# Altium schematic sheet 06_RISK_ALERT.SchDoc
size A4; SheetNumber: 6; SheetTotal: 6
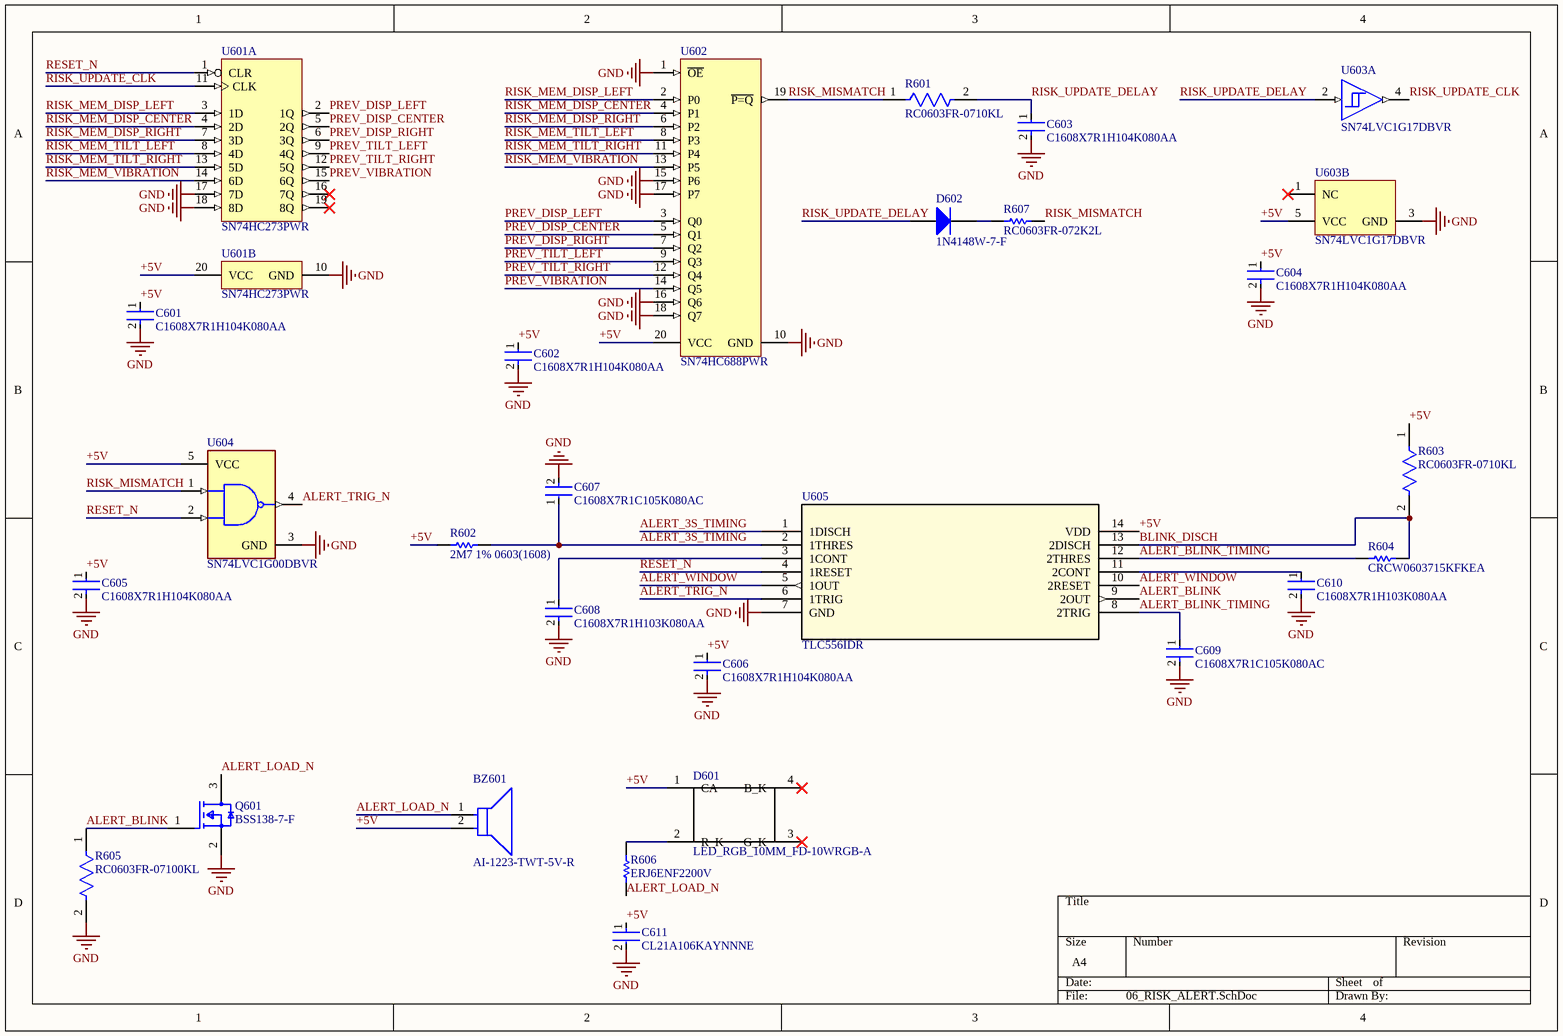
[diagram p0: 06_RISK_ALERT.SchDoc]

## Parts
BZ601  AI-1223-TWT-5V-R  [FP-AI-1223-TWT-5V-R-MFG]
C601  C1608X7R1H104K080AA  [FP-C1608-080-0_1-IPC_B]
C602  C1608X7R1H104K080AA  [FP-C1608-080-0_1-IPC_B]
C603  C1608X7R1H104K080AA  [FP-C1608-080-0_1-IPC_B]
C604  C1608X7R1H104K080AA  [FP-C1608-080-0_1-IPC_B]
C605  C1608X7R1H104K080AA  [FP-C1608-080-0_1-IPC_B]
C606  C1608X7R1H104K080AA  [FP-C1608-080-0_1-IPC_B]
C607  C1608X7R1C105K080AC  [FP-C1608-080-0_1-IPC_B]
C608  C1608X7R1H103K080AA  [FP-C1608-080-0_1-MFG]
C609  C1608X7R1C105K080AC  [FP-C1608-080-0_1-IPC_B]
C610  C1608X7R1H103K080AA  [FP-C1608-080-0_1-MFG]
C611  CL21A106KAYNNNE  [FP-CL21-IPC_A]
D601  LED_RGB_10MM_FD-10WRGB-A  [LED_THT_RGB_10MM_FD10WRGBA]
D602  1N4148W-7-F  [DIOD-SOD123-2_V]
Q601  BSS138-7-F  [FP-SOT23_Standard-MFG]
R601  RC0603FR-0710KL  [FP-RC0603-0_55-IPC_C]
R602  2M7 1% 0603(1608)  [RESC0603(1608)_L]
R603  RC0603FR-0710KL  [FP-RC0603-0_55-IPC_C]
R604  CRCW0603715KFKEA  [RESC1609X50X30NL10T20]
R605  RC0603FR-07100KL  [FP-RC0603-0_55-MFG]
R606  ERJ6ENF2200V  [RESC2013X70X40NL20T20]
R607  RC0603FR-072K2L  [RESC1608X55X25LL10T15]
U601  SN74HC273PWR  [PW0020A_N]  (parts A,B of 2)
U602  SN74HC688PWR  [PW0020A_M]
U603  SN74LVC1G17DBVR  [DBV0005A_L]  (parts A,B of 2)
U604  SN74LVC1G00DBVR  [FP-DBV0005A-MFG]
U605  TLC556IDR  [D14]

## Nets
GND: C601.2 C602.2 C603.2 C604.2 C605.2 C606.2 C607.2 C608.2 C609.2 C610.2 C611.2 Q601.2(S) R605.2 U601.10(GND) U601.17(7D) U601.18(8D) U602.1(~{OE}) U602.10(GND) U602.15(P6) U602.16(Q6) U602.17(P7) U602.18(Q7) U603.3(GND) U604.3(GND) U605.7(GND)
+5V: BZ601.2(A) C601.1 C602.1 C604.1 C605.1 C606.1 C611.1 D601.1(CA) R602.1 R603.1 U601.20(VCC) U602.20(VCC) U603.5(VCC) U604.5(VCC) U605.14(VDD)
ALERT_3S_TIMING: C607.1 R602.2 U605.1(1DISCH) U605.2(1THRES)
ALERT_BLINK: Q601.1(G) R605.1 U605.9(2OUT)
ALERT_BLINK_TIMING: C609.1 R604.1 U605.8(2TRIG) U605.12(2THRES)
ALERT_LOAD_N: BZ601.1(C) Q601.3(D) R606.2
ALERT_TRIG_N: U604.4(Y) U605.6(1TRIG)
ALERT_WINDOW: U605.5(1OUT) U605.10(2RESET)
BLINK_DISCH: R603.2 R604.2 U605.13(2DISCH)
PREV_DISP_CENTER: U601.5(2Q) U602.5(Q1)
PREV_DISP_LEFT: U601.2(1Q) U602.3(Q0)
PREV_DISP_RIGHT: U601.6(3Q) U602.7(Q2)
PREV_TILT_LEFT: U601.9(4Q) U602.9(Q3)
PREV_TILT_RIGHT: U601.12(5Q) U602.12(Q4)
PREV_VIBRATION: U601.15(6Q) U602.14(Q5)
RESET_N: U601.1(CLR) U604.2(B) U605.4(1RESET)
RISK_MEM_DISP_CENTER: U601.4(2D) U602.4(P1)
RISK_MEM_DISP_LEFT: U601.3(1D) U602.2(P0)
RISK_MEM_DISP_RIGHT: U601.7(3D) U602.6(P2)
RISK_MEM_TILT_LEFT: U601.8(4D) U602.8(P3)
RISK_MEM_TILT_RIGHT: U601.13(5D) U602.11(P4)
RISK_MEM_VIBRATION: U601.14(6D) U602.13(P5)
RISK_MISMATCH: R601.1 R607.2 U602.19(~{P=Q}) U604.1(A)
RISK_UPDATE_CLK: U601.11(CLK) U603.4(Y)
RISK_UPDATE_DELAY: C603.1 D602.1(A) R601.2 U603.2(A)
NetC608_1: C608.1 U605.3(1CONT)
NetC610_1: C610.1 U605.11(2CONT)
NetD601_2: D601.2(R_K) R606.1
NetD602_2: D602.2(K) R607.1

Not connected (* = marked no-connect by the designer): D601 3(G_K)* 4(B_K)*; U601 16(7Q)* 19(8Q)*; U603 1(NC)*

## Library data of the parts
BZ601 = CMP-231724-000001-1: AUDIO MAGNETIC INDICATOR 3-7V TH; Input Type: DC; Bandwidth: 2.3kHz; Nominal Supply Voltage (DC): 5V; Max Supply Current: 30mA; Washable: Yes; Max Supply Voltage (DC): 7V; Min Supply Voltage: 3V; Series: AI; Width: 12mm; REACH SVHC: No SVHC; Contact Plating: Tin; Frequency: 2.3kHz; Operating Supply Current: 30mA; Weight: 0.01lb; Current Rating: 30mA; Mount: Through Hole; Packaging: Tray; Length: 12mm; Lead Free: Lead Free; Color: Black; Input Current: 30mA; Min Operating Temperature: -40°C; Self Resonant Frequency: 2.3kHz; Sensing Method: Magnetic; Voltage Rating (DC): 5V; Height: 9.5mm; Termination: PC Pins; Min Supply Voltage (DC): 3V; Package Quantity: 100; Max Supply Voltage: 7V; Diameter: 12mm; Max Operating Temperature: 85°C
C601-C606 = CMP-2000-04982-2: Multilayer Ceramic Capacitors 100nF ±10% 50V X7R SMD 0603; REACH SVHC: No SVHC; Voltage: 50V; Min Operating Temperature: -55°C; Package Quantity: 1; Case Code (Metric): 1608; Series: C; Termination: SMD/SMT; Length: 1.6mm; Voltage Rating: 50V; Case Code (Imperial): 0603; Number of Pins: 2; RoHS Compliant: Yes; Thickness: 0.037inch; Resistor Type: Ceramic; Radiation Hardening: No; Weight: 7.1E-05oz; Mount: Surface Mount; Capacitance: 100nF; Voltage Rating (DC): 50V; Construction: Flat; Tolerance: 10%; Lead Free: Lead Free; Case/Package: 0603; Max Operating Temperature: 125°C; Height: 0.8mm; Depth: 0.8mm; Packaging: Tape and Reel; Width: 0.031inch; Dielectric Material: Ceramic; Dielectric: X7R
C607 C609 = CMP-08246-002727-1: Multilayer Ceramic Capacitors 1μF ±10% 16V X7R SMD 0603; Capacitance: 1uF; Mount: Surface Mount; Width: 0.031inch; Radiation Hardening: No; Dielectric Material: Ceramic; Packaging: Tape and Reel; Voltage Rating: 16V; Weight: 7.1E-05oz; Termination: SMD/SMT; Package Quantity: 1; Voltage Rating (DC): 16V; REACH SVHC: No SVHC; Voltage: 16V; Min Operating Temperature: -55°C; Depth: 0.8mm; Height: 0.8mm; Length: 1.6mm; Case Code (Metric): 1608; Thickness: 0.037inch; Lead Free: Lead Free; Resistor Type: Ceramic; RoHS Compliant: Yes; Series: C; Construction: Flat; Max Operating Temperature: 125°C; Tolerance: 10%; Case/Package: 0603; Dielectric: X7R; Case Code (Imperial): 0603
C608 C610 = CMP-2000-06026-2: Multilayer Ceramic Capacitors 10nF ±10% 50V X7R SMD 0603; Voltage: 50V; Depth: 0.8mm; REACH SVHC: No SVHC; Packaging: Tape and Reel; Dielectric Material: Ceramic; Dielectric: X7R; Min Operating Temperature: -55°C; Package Quantity: 1; Width: 0.031inch; Case Code (Imperial): 0603; Radiation Hardening: No; Length: 1.6mm; RoHS Compliant: Yes; Tolerance: 10%; Termination: SMD/SMT; Mount: Surface Mount; Construction: Flat; Resistor Type: Ceramic; Max Operating Temperature: 125°C; Series: C; Lead Free: Lead Free; Capacitance: 10nF; Voltage Rating (DC): 50V; Thickness: 0.037inch; Voltage Rating: 50V; Height: 0.8mm; Weight: 7.1E-05oz; Case/Package: 0603; Case Code (Metric): 1608
C611 = CMP-13271-002975-1: CL21 Series 0805 10uF 25V ±10% Tolerance X5R Multilayer Ceramic Chip Capacitor; Case Code (Imperial): 0805; Length: 2mm; Case/Package: 0805; Packaging: Tape and Reel; Width: 0.049inch; Tolerance: 10%; Mount: Surface Mount; Min Operating Temperature: -55°C; Thickness: 0.057inch; Height: 1.25mm; Dielectric: X5R; Package Quantity: 1; Depth: 1.25mm; Capacitance: 10uF; Voltage Rating: 25V; Case Code (Metric): 2012; Max Operating Temperature: 85°C; Radiation Hardening: No
D602 = CMP-2000-04932-2: Fast Switching Diode, 100 V, 0.15 A, -65 to 150 degC, 2-Pin?SOD123, RoHS, Tape and Reel; Recovery Time: 4ns; Brand: DiodesIncorporated; Unit Weight: 0.000353oz; Max Surge Current: 2A; Peak Reverse Voltage: 100V; Ir - Reverse Current: 1uA; Vf - Forward Voltage: 1.25V; Configuration: Single; If - Forward Current: 0.15A; Product Category: Diodes-GeneralPurpose,Power,Switching; Operating Temperature Range: -65Cto+150C; Packaging: Reel; Manufacturer URL: http://www.diodes.com/; Maximum Operating Temperature: +150C; Height: 1.25mm; Minimum Operating Temperature: -65C; Product: SwitchingDiodes; Package URL: http://www.diodes.com/datasheets/ds18004.pdf; Type: SwitchingDiode; Package Reference: SOD123-2; Width: 1.7mm; Datasheet URL: http://www.farnell.com/datasheets/1915529.pdf; Datasheet Version: Rev. 24-2, 10/2013; Series: 1N4148; Factory Pack Quantity: 3000; Length: 2.85mm; RoHS: True; Manufacturer: DiodesIncorporated; Mounting Style: SMD/SMT; Package / Case: SOD-123
Q601 = CMP-2000-04930-2: NexarPartId: 335900; Voltage: 50V; Fall Time: 25ns; Number of Elements: 1; Turn-On Delay Time: 20ns; Drain to Source Resistance: 1.4Ω; Element Configuration: Single; Max Power Dissipation: 300mW; Current Rating: 200mA; Max Junction Temperature (Tj): 150°C; Input Capacitance: 50pF; Threshold Voltage: 1.2V; Current: 2A; Rds On Max: 3.5Ω; Rise Time: 10ns; Gate to Source Voltage (Vgs): 20V; Number of Pins: 3; Width: 1.3mm; Case/Package: SOT-23; Lead Free: Lead Free; Height: 1.15mm; Packaging: Cut Tape; Length: 2.9mm; REACH SVHC: No SVHC; Weight: 7.994566mg; Voltage Rating (DC): 50V; Contact Plating: Tin; Power Dissipation: 300mW; Mount: Surface Mount; Min Operating Temperature: -55°C; RoHS: Compliant; Max Operating Temperature: 150°C; Schedule B: 8541210080, 8541210080; Drain to Source Breakdown Voltage: 50V; Continuous Drain Current (ID): 200mA; Resistance: 3.5Ω; Number of Channels: 1; Drain to Source Voltage (Vdss): 50V; Turn-Off Delay Time: 20ns; Nominal Vgs: 1.2V
R601 R603 = CMP-2100-03664-2: RES 10K OHM 1% 1/10W 0603; Voltage Rating: 75V; Voltage Rating (DC): 50V; Resistance: 10kR; Power Rating: 100mW; Temperature Coefficient: 100ppm/°C; Depth: 0.8mm; Termination: SMD/SMT; Resistor Type: Thick Film; Series: RC; Construction: Rectangular; Features: Moisture Resistant; Packaging: Tape and Reel; Min Operating Temperature: -55°C; Number of Terminations: 2; Lead Pitch: 0.3mm; RoHS Compliant: Yes; Case/Package: 0603; Resistance Tolerance: 1%; Military Standard: Not; Weight: 7.1E-05oz; Number of Pins: 2; Tolerance: 1%; Length: 1.6mm; Case Code (Imperial): 0603; Lead Free: Lead Free; Width: 0.8mm; Max Power Dissipation: 100mW; Height: 0.45mm; Max Operating Temperature: 155°C; Case Code (Metric): 1608; Size Code: 0603
R602 = CMP-1012-00896-1: 2M7 0.1W 1% 0603 (1608 Metric)  SMD; Case-Metric: 1608; Value: 2700000.00 Ohm; Case-EIA: 0603; Power: 0.1 W; Technology: SMT; Tolerance: 1 %
R604 = CMP-2000-03560-1: Manufacturer: Vishay Dale; Part Number: CRCW0603715KFKEA
R605 = CMP-2100-03662-2: RES SMD 100K OHM 1% 1/10W 0603; Voltage Rating (DC): 50V; Resistance: 100kR; Max Power Dissipation: 100mW; Temperature Coefficient: 100ppm/°C; Working Voltage: 75V; Length: 1.6mm; Lead Free: Lead Free; Number of Terminations: 2; Packaging: Tape and Reel; Voltage Rating: 50V; Termination: SMD/SMT; Width: 0.8mm; Resistor Type: Thick Film; Resistance Tolerance: 1%; Features: Moisture Resistant; Height: 0.45mm; Construction: Rectangular; Case/Package: 0603; Military Standard: Not; Case Code (Imperial): 0603; Series: RC; Technology: THICK FILM; Depth: 0.8mm; RoHS Compliant: Yes; REACH SVHC: No SVHC; Min Operating Temperature: -55°C; Case Code (Metric): 1608; Max Operating Temperature: 155°C; Power Rating: 100mW; Number of Pins: 2; Tolerance: 1%
R606 = CMP-2001-00044-1: Manufacturer: Panasonic; Part Number: ERJ6ENF2200V
R607 = CMP-2000-06934-1: Thick Film Resistor, 2.2 KOhm, 100 mW, 50 V, +/- 1%, -55 to 155 degC, 2-Pin SMD (0603), RoHS, Tape and Reel; Manufacturer: Yageo; Resistance: 2.2kOhms; Temperature Coefficient: 100PPM/C; Voltage Rating: 50V; Power Rating: 100mW; Tolerance: 1%; Datasheet Version: Rev. 7, 05/2017; Case Code - mm: 1608; Series: RC; Mounting Technology: SurfaceMount; Package Description: 2-Pin Surface Mount Device, Body 1.6 x 0.8 mm; Case Code - in: 0603; Package Reference: 0603; Product: ThickFilmResistorsGeneralPurpose; Manufacturer URL: http://www.yageo.com/; Termination Style: SMD/SMT; Operating Temperature Range: -55Cto+155C; Datasheet URL: http://www.yageo.com/documents/recent/PYu-RC_Group_51_RoHS_L_7.pdf; Packaging: Reel
U601 = CMP-1619-00964-2: Octal D-Type Flip-Flops With Clear, PW0020A, LARGE T&R; Manufacturer: Texas Instruments; VCC(Min)(V): 2; VCC(Max)(V): 6; Schmitt Trigger: No; Rating: Catalog; Output Drive (IOL/IOH)(Max)(mA): 5.2/-5.2; Output Type: CMOS; Bits(#): 8; tpd @ Nom Voltage(Max)(ns): 34; F @ Nom Voltage(Max)(Mhz): 28; Output: 2S; ICC @ Nom Voltage(Max)(mA): 0.08; Technology Family: HC; Voltage(Nom)(V): 3.3,5; Output Logic: Non-inverted; Code_JEDEC: MO-153; PackageReference: PW0020A; DatasheetVersion: SCLS136D; 3-State Output: No; Operating Temperature Range(C): -40 to 85; Generic Part Number: SN74HC273; Input Type: CMOS
U602 = CMP-1581-00122-3: 8-Bit Identity/Magnitude Comparators (P=Q) with Enable, PW0020A, LARGE T&R; Manufacturer: Texas Instruments; ICC @ Nom Voltage(Max)(mA): 0.08; F @ Nom Voltage(Max)(Mhz): 70; Bits(#): 8; tpd @ Nom Voltage(Max)(ns): 45; VCC(Max)(V): 6; Output Type: CMOS; VCC(Min)(V): 2; Technology Family: HC; Rating: Catalog; Schmitt Trigger: No; Output Drive (IOL/IOH)(Max)(mA): 5.2/-5.2; DatasheetVersion: SCLS010D; Operating Temperature Range(C): -40 to 85; Generic Part Number: SN74HC688; Voltage(Nom)(V): 6; Input Type: CMOS; PackageReference: PW0020A
U603 = CMP-0859-00033-4: Single Schmitt-Trigger Buffer, DBV0005A, LARGE T&R; Manufacturer: Texas Instruments; Output Drive (IOL/IOH)(Max)(mA): 32/-32; Technology Family: LVC; ICC @ Nom Voltage(Max)(mA): 0.01; VCC(Min)(V): 1.65; F @ Nom Voltage(Max)(Mhz): 150; Schmitt Trigger: Yes; Voltage(Nom)(V): 1.8,2.5,3.3,5; 3-State Output: No; Bits(#): 1; VCC(Max)(V): 5.5; Input Type: CMOS/TTL; Logic: True; tpd @ Nom Voltage(Max)(ns): 11,6.5,5.5,5; Output Type: CMOS; Rating: Catalog; Sub-Family: Non-Inverting Buffer/Driver; PackageReference: DBV0005A; DatasheetVersion: SCES351V; Generic Part Number: SN74LVC1G17; Operating Temperature Range(C): -40 to 125,-40 to 85
U604 = CMP-0859-00113-4: IC GATE NAND 1CH 2-INP SOT23-5; Manufacturer: Texas Instruments; Logic Function Desc: Inverting; Number Of Circuits: 1; Nominal Supply Current: 10uA; Max Supply Voltage: 5.5V; Standoff Height: 0mm; Frequency: 100MHz; Propagation Delay: 4.3ns; Min Supply Voltage: 1.65V; Number Of Inputs: 2; Digikey Description: IC GATE NAND 1CH 2-INP SOT23-5; Ipc Land Pattern Name: SOT95P280X145-5; Automotive: No; RoHS: TRUE; Mouser Description: IC Mos 74LVC1G00/SO/SN74LVC1G00DBVR TEXAS INSTRUMENT RoHS LVC SOt23; Package: DBV0005A; ComponentLink2URL: http://www.ti.com/lit/ds/symlink/sn74lvc1g00.pdf; Device Class L2: Logic ICs; Ambient Temperature Range Low: -40°C; Temperature Range Low: -40°C; Ambient Temperature Range High: +125°C; Device Class L1: Integrated Circuits (ICs); Height: 1.45mm; Octopart: https://octopart.com/sn74lvc1g00dbvr-texas+instruments-465560; Temperature: -40°C to +125°C; Temperature Range High: +125°C; Category: IC; ComponentLink2Description: Datasheet; Number Of Outputs: 1; Device Class L3: Logic Gates; Manufacturer Part Number: SN74LVC1G00DBVR; Lead Free: Yes
U605 = TLC556IDR: 15V Dual LinCMOS timer 14-SOIC -40 to 85; Manufacturer_Name: Texas Instruments; Copyright: Copyright (C) 2026 Ultra Librarian. All rights reserved.; Manufacturer_Part_Number: TLC556IDR; Datasheet: https://www.ti.com/lit/gpn/tlc556; RefDes: RefDes; Type: Type